# Altium schematic sheet USB_Sheet_2.SchDoc
size A4; DocumentNumber: 20; SheetNumber: 20; SheetTotal: 27
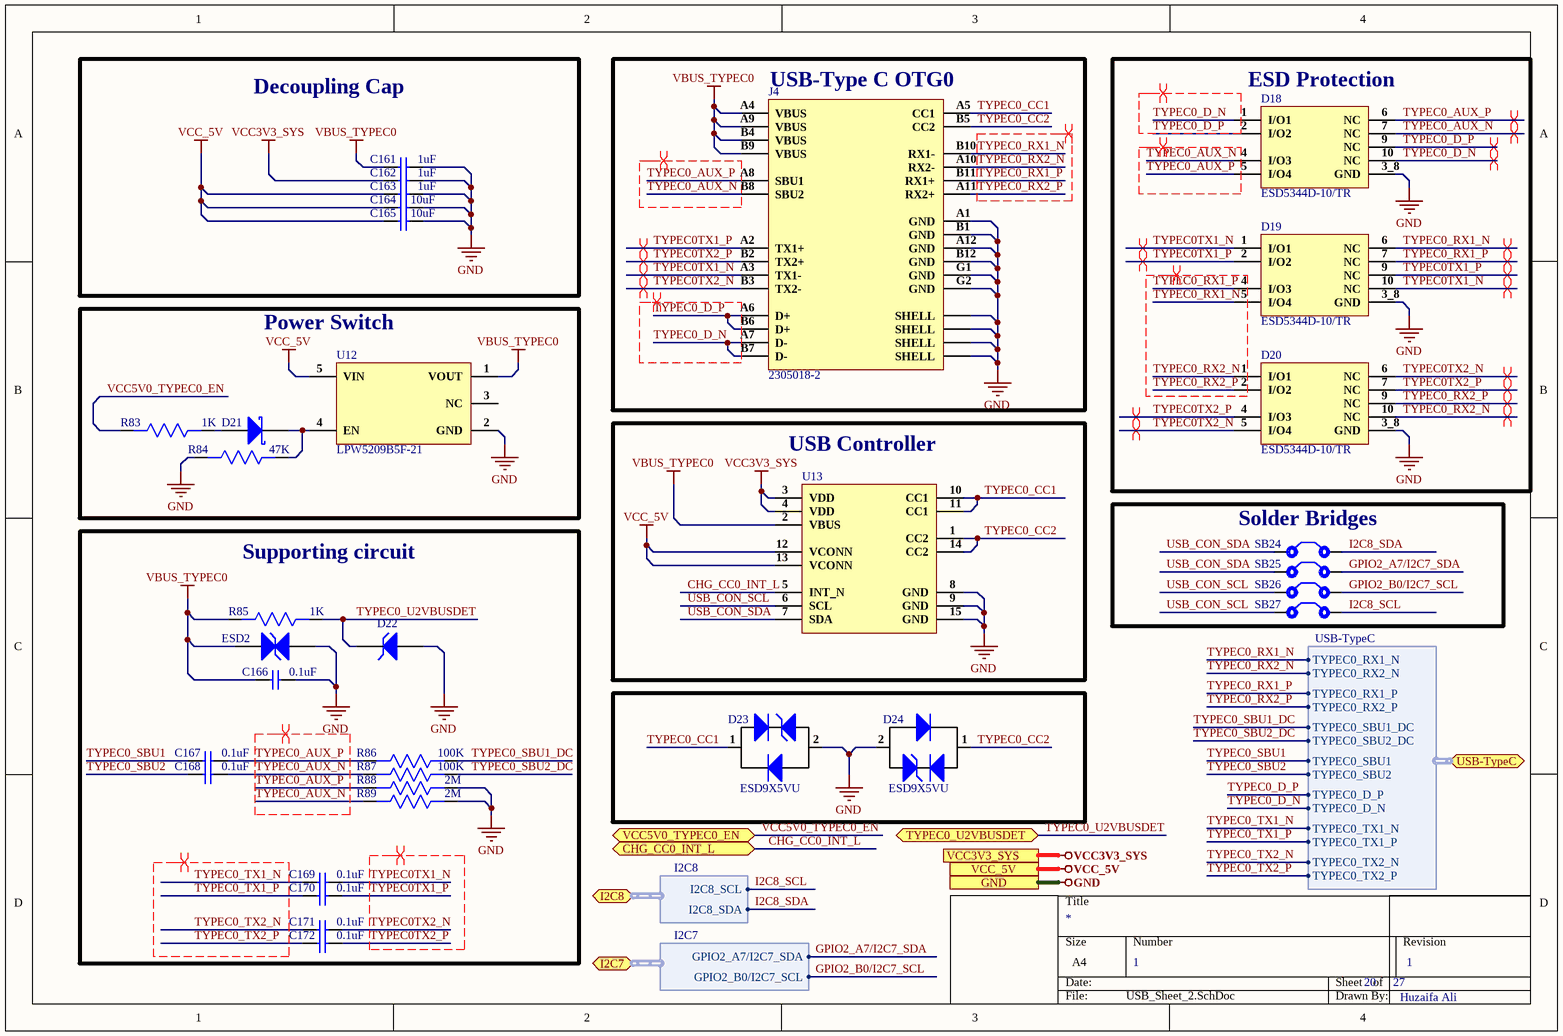
[diagram p0: USB_Sheet_2.SchDoc]

## Parts
C161  1uF  [Cap0402]
C162  1uF  [Cap0402]
C163  1uF  [Cap0402]
C164  10uF  [Cap0603]
C165  10uF  [Cap0603]
C166  0.1uF  [Cap0402]
C167  0.1uF  [Cap0402]
C168  0.1uF  [Cap0402]
C169  0.1uF  [Cap0402]
C170  0.1uF  [Cap0402]
C171  0.1uF  [Cap0402]
C172  0.1uF  [Cap0402]
D18  ESD5344D-10/TR  [DFN2510-10L]
D19  ESD5344D-10/TR  [DFN2510-10L]
D20  ESD5344D-10/TR  [DFN2510-10L]
D21  B5819WS  [SOD-323]  (value not drawn)
D22  BZT52C3V3-E3-08  [SOD-123]  (value not drawn)
D23  ESD9X5VU  [DFN1006-2L]
D24  ESD9X5VU  [DFN1006-2L]
ESD2  AZ5825-01F  [DFN1006-2L]  (value not drawn)
J4  2305018-2  [2305018-2]
R83  1K  [Res0603]
R84  47K  [Res0603]
R85  1K  [Res0603]
R86  100K  [Res0603]
R87  100K  [Res0603]
R88  2M  [Res0603]
R89  2M  [Res0603]
SB24  Solder Bridge  [Solder Bridge]  (value not drawn)
SB25  Solder Bridge  [Solder Bridge]  (value not drawn)
SB26  Solder Bridge  [Solder Bridge]  (value not drawn)
SB27  Solder Bridge  [Solder Bridge]  (value not drawn)
U12  LPW5209B5F-21  [SOT-23-5]
U13  FUSB302BMPX  [14-MLP (2.5x2.5)]  (value not drawn)

## Blocks framed on the sheet
Decoupling Cap: C161-C165
USB-Type C OTG0: J4
ESD Protection: D18-D20
Power Switch: D21 R83 R84 U12
USB Controller: U13
Solder Bridges: SB24-SB27
Supporting circuit: C166-C172 D22 ESD2 R85-R89

## Ports
CHG_CC0_INT_L (bidir), GND, I2C7 (bidir, harness I2C7), I2C8 (bidir, harness I2C8), TYPEC0_U2VBUSDET (bidir), USB-TypeC (bidir, harness USB-TypeC), VCC3V3_SYS, VCC5V0_TYPEC0_EN (bidir), VCC_5V

## Harnesses
I2C7: GPIO2_B0/I2C7_SCL, GPIO2_A7/I2C7_SDA
I2C8: I2C8_SDA, I2C8_SCL
USB-TypeC: TYPEC0_RX1_N, TYPEC0_RX2_N, TYPEC0_RX1_P, TYPEC0_RX2_P, TYPEC0_D_P, TYPEC0_D_N, TYPEC0_TX1_N, TYPEC0_TX1_P, TYPEC0_TX2_N, TYPEC0_TX2_P, TYPEC0_SBU1, TYPEC0_SBU2, TYPEC0_SBU1_DC, TYPEC0_SBU2_DC

## Nets
GND: C161.2 C162.2 C163.2 C164.2 C165.2 C166.2 D18.3_8(GND) D19.3_8(GND) D20.3_8(GND) D22.1(A) D23.2 D24.2 ESD2.2(A) J4.A1(GND) J4.A12(GND) J4.B1(GND) J4.B12(GND) J4.G1(GND) J4.G2(GND) J4.S1(SHELL) J4.S2(SHELL) J4.S3(SHELL) J4.S4(SHELL) R84.2 R88.1 R89.1 U12.2(GND) U13.8(GND) U13.9(GND) U13.15(GND) ; port GND
VBUS_TYPEC0: C161.1 C166.1 ESD2.1(A) J4.A4(VBUS) J4.A9(VBUS) J4.B4(VBUS) J4.B9(VBUS) R85.2 U12.1(VOUT) U13.2(VBUS)
VCC3V3_SYS: C162.1 U13.3(VDD) U13.4(VDD) ; port VCC3V3_SYS
VCC_5V: C163.1 C164.1 C165.1 U12.5(VIN) U13.12(VCONN) U13.13(VCONN) ; port VCC_5V
CHG_CC0_INT_L: U13.5(INT_N) ; port CHG_CC0_INT_L
GPIO2_A7/I2C7_SDA: SB25.2 ; port I2C7.GPIO2_A7/I2C7_SDA
GPIO2_B0/I2C7_SCL: SB26.2 ; port I2C7.GPIO2_B0/I2C7_SCL
I2C8_SCL: SB27.2 ; port I2C8.I2C8_SCL
I2C8_SDA: SB24.2 ; port I2C8.I2C8_SDA
TYPEC0_AUX_N: C168.2 D18.4(I/O3) D18.7(NC) J4.B8(SBU2) R87.2 R89.2
TYPEC0_AUX_P: C167.2 D18.5(I/O4) D18.6(NC) J4.A8(SBU1) R86.2 R88.2
TYPEC0_CC1: D23.1 J4.A5(CC1) U13.10(CC1) U13.11(CC1)
TYPEC0_CC2: D24.1 J4.B5(CC2) U13.1(CC2) U13.14(CC2)
TYPEC0_D_N: D18.1(I/O1) D18.10(NC) J4.A7(D-) J4.B7(D-) ; port USB-TypeC.TYPEC0_D_N
TYPEC0_D_P: D18.2(I/O2) D18.9(NC) J4.A6(D+) J4.B6(D+) ; port USB-TypeC.TYPEC0_D_P
TYPEC0_RX1_N: D19.5(I/O4) D19.6(NC) J4.B10(RX1-) ; port USB-TypeC.TYPEC0_RX1_N
TYPEC0_RX1_P: D19.4(I/O3) D19.7(NC) J4.B11(RX1+) ; port USB-TypeC.TYPEC0_RX1_P
TYPEC0_RX2_N: D20.1(I/O1) D20.10(NC) J4.A10(RX2-) ; port USB-TypeC.TYPEC0_RX2_N
TYPEC0_RX2_P: D20.2(I/O2) D20.9(NC) J4.A11(RX2+) ; port USB-TypeC.TYPEC0_RX2_P
TYPEC0_SBU1: C167.1 ; port USB-TypeC.TYPEC0_SBU1
TYPEC0_SBU1_DC: R86.1 ; port USB-TypeC.TYPEC0_SBU1_DC
TYPEC0_SBU2: C168.1 ; port USB-TypeC.TYPEC0_SBU2
TYPEC0_SBU2_DC: R87.1 ; port USB-TypeC.TYPEC0_SBU2_DC
TYPEC0_TX1_N: C169.1 ; port USB-TypeC.TYPEC0_TX1_N
TYPEC0_TX1_P: C170.1 ; port USB-TypeC.TYPEC0_TX1_P
TYPEC0_TX2_N: C171.1 ; port USB-TypeC.TYPEC0_TX2_N
TYPEC0_TX2_P: C172.1 ; port USB-TypeC.TYPEC0_TX2_P
TYPEC0_U2VBUSDET: D22.2(K) R85.1 ; port TYPEC0_U2VBUSDET
TYPEC0TX1_N: C169.2 D19.1(I/O1) D19.10(NC) J4.A3(TX1-)
TYPEC0TX1_P: C170.2 D19.2(I/O2) D19.9(NC) J4.A2(TX1+)
TYPEC0TX2_N: C171.2 D20.5(I/O4) D20.6(NC) J4.B3(TX2-)
TYPEC0TX2_P: C172.2 D20.4(I/O3) D20.7(NC) J4.B2(TX2+)
USB_CON_SCL: SB26.1 SB27.1 U13.6(SCL)
USB_CON_SDA: SB24.1 SB25.1 U13.7(SDA)
VCC5V0_TYPEC0_EN: R83.2 ; port VCC5V0_TYPEC0_EN
NetD21_1: D21.1(K) R84.1 U12.4(EN)
NetD21_2: D21.2(A) R83.1

Not connected (* = marked no-connect by the designer): U12 3(NC)

## Layout directives
differential pair; differential pair class TYPEC0_IO_Lines; net class TYPEC0; rule Matched Net Lengths [Tolerance = 50mil]; rule Impedance Constraint [Min = 85.00    Max = 90.00    ]: TYPEC0_D_N, TYPEC0_D_P, TYPEC0_RX1_N, TYPEC0_RX1_P, TYPEC0_RX2_N, TYPEC0_RX2_P, TYPEC0_TX1_N, TYPEC0_TX1_P, TYPEC0_TX2_N, TYPEC0_TX2_P, TYPEC0TX1_N, TYPEC0TX1_P, TYPEC0TX2_N, TYPEC0TX2_P
differential pair; differential pair class TYPEC0_AUX_Lines; net class TYPEC0_AUX; rule Matched Net Lengths [Tolerance = 300mil]; rule Impedance Constraint [Min = 85.00    Max = 90.00    ]: TYPEC0_AUX_N, TYPEC0_AUX_P
differential pair; differential pair class TYPEC0_TX_Lines; net class TYPEC0_TX; rule Matched Net Lengths [Tolerance = 50mil]; rule Impedance Constraint [Min = 85.00    Max = 90.00    ]: TYPEC0TX1_N, TYPEC0TX1_P, TYPEC0TX2_N, TYPEC0TX2_P

## Notes on the sheet
- 1
- Huzaifa Ali

## Library data of the parts
C161-C163 = GRM155R61E105KA12D: CAP CER 1UF 25V X5R 0402; Manufacturer: Murata; Material: Ceramic; Tolerance: 10%; Supplier 1: Digi-Key; Manufacturer Part Number: GRM155R61E105KA12D; Stock 1: 1194305; Pricing 1: 1=0.11, 10=0.077, 100=0.0363, 500=0.02546, 1000=0.02108, 2500=0.01962, 5000=0.01795 (USD); Mount: Surface Mount; Case/Package: 0402; Weight: 0.000212oz; Case Code (Metric): 1005; Case Code (Imperial): 0402; Min Operating Temperature: -55°C; Max Operating Temperature: 85°C; Capacitance: 1uF; Voltage Rating: 25V; Packaging: Tape and Reel; Dielectric: X5R; Voltage: 25V; Termination: SMD/SMT; Voltage Rating (DC): 25V; Package Quantity: 10000; Length: 1mm; Height: 0.5mm; Width: 0.5mm; Thickness: 0.022inch; Depth: 0.5mm; REACH SVHC: No SVHC; Lead Free: Lead Free; ComponentLink1URL: http://www.farnell.com/datasheets/2048341.pdf?src-supplier=Element14; ComponentLink1Description: http://www.farnell.com/datasheets/2048341.pdf?src-supplier=Element14; Supplier Part Number 1: 490-10017-1-ND
C164 C165 = C1608X5R1E106M080AC: CAP CER 10UF 25V X5R 0603; Manufacturer: TDK; Dielectric Material: Ceramic; Tolerance: 20%; Supplier 1: Digi-Key; Manufacturer Part Number: C1608X5R1E106M080AC; Stock 1: 61681; Pricing 1: 1=0.96, 10=0.704, 100=0.483, 500=0.38238, 1000=0.322 (USD); Mount: Surface Mount; Case/Package: 0603; Weight: 7.1E-05oz; Case Code (Imperial): 0603; Case Code (Metric): 1608; Min Operating Temperature: -55°C; Max Operating Temperature: 85°C; Capacitance: 10uF; Packaging: Tape and Reel; Voltage Rating: 25V; Voltage Rating (DC): 25V; Termination: SMD/SMT; Package Quantity: 1; Dielectric: X5R; Composition: Ceramic; Length: 1.6mm; Height: 0.8mm; Width: 0.8mm; Thickness: 0.039inch; Depth: 0.8mm; Lead Free: Lead Free; REACH SVHC: No SVHC; Supplier Part Number 1: 445-9015-1-ND
C166-C172 = CC0402KRX5R6BB104: CAP CER 0.1UF 10V X5R 0402; Manufacturer: Yageo; Capacitance: 100nF; Tolerance: 10%; Dissipation Factor: 5%; Insulation Resistance: 10GR; Supplier 1: Digi-Key; Manufacturer Part Number: CC0402KRX5R6BB104; RoHS: Yes; Category: Ceramic Capacitors; Stock 1: 6385580; Pricing 1: 1=0.10000, 10=0.02700, 50=0.01500, 100=0.01220, 500=0.00874, 1000=0.00687, 2500=0.00625, 5000=0.00575 (USD); Mount: Surface Mount; Case/Package: 0402; Number of Pins: 2; Case Code (Imperial): 0402; Case Code (Metric): 1005; Min Operating Temperature: -55°C; Max Operating Temperature: 85°C; Dielectric: X5R; Packaging: Tape and Reel; Voltage Rating: 10V; Package Quantity: 1; Termination: SMD/SMT; Voltage Rating (DC): 10V; Series: CC; Length: 1mm; Width: 0.02inch; Height: 0.5mm; Depth: 0.5mm; Thickness: 0.022inch; Radiation Hardening: No; RoHS Compliant: Yes; REACH SVHC: No SVHC; Lead Free: Lead Free; Halogen Free: Halogen Free; ComponentLink1URL: https://datasheet.ciiva.com/144/mlccorderingcode-144029.pdf?src-supplier=Digi-Key; ComponentLink1Description: https://datasheet.ciiva.com/144/mlccorderingcode-144029.pdf?src-supplier=Digi-Key; ComponentLink2URL: https://datasheet.ciiva.com/144/mlccorderingcode-144028.pdf?src-supplier=Digi-Key; ComponentLink2Description: https://datasheet.ciiva.com/144/mlccorderingcode-144028.pdf?src-supplier=Digi-Key; ComponentLink3URL: https://datasheet.ciiva.com/144/mlccorderingcode-144030.pdf?src-supplier=Digi-Key; ComponentLink3Description: https://datasheet.ciiva.com/144/mlccorderingcode-144030.pdf?src-supplier=Digi-Key; ComponentLink4URL: https://datasheet.ciiva.com/7978/1359354-7978091.pdf?src-supplier=Element14; ComponentLink4Description: https://datasheet.ciiva.com/7978/1359354-7978091.pdf?src-supplier=Element14; ComponentLink5URL: https://datasheet.ciiva.com/11587/upy-gphc-x5r-4v-to-50v-12-11587302.pdf?src-supplier=Avnet; ComponentLink5Description: https://datasheet.ciiva.com/11587/upy-gphc-x5r-4v-to-50v-12-11587302.pdf?src-supplier=Avnet; Supplier Part Number 1: 311-1336-1-ND
D18-D20 = ESD5344D-10/TR: DFN2510-10L ESD Protection Devices ROHS; Manufacturer: WILLSEMI; ComponentLink1Description: LCSC; ComponentLink1URL: https://www.lcsc.com/product-detail/span-style-background-color-ff0-ESD-span-Protection-Devices_WILLSEMI-Will-Semicon-ESD5344D-10-TR_C239666.html; Manufacturer Part Number: ESD5344D-10/TR
D21 = B5819WS: DIODE SCHOTTKY 40V 1A SOD323; Manufacturer: MDD; Manufacturer Part Number: B5819WS-TP; Max Surge Current: 10A; Forward Voltage: 900mV; Max Reverse Leakage Current: 1mA; Element Configuration: Single; Supplier 1: Arrow Electronics; RoHS: Yes; Category: Rectifier Diodes; Stock 1: 1701; Pricing 1: 1=0.34370, 10=0.18990, 25=0.18810, 100=0.11820, 250=0.11700, 500=0.08890, 1000=0.07420 (USD); Mount: Surface Mount; Number of Pins: 2; Min Operating Temperature: -65°C; Max Operating Temperature: 125°C; Package Quantity: 1; Packaging: Tape and Reel; Average Rectified Current: 1A; Peak Non-Repetitive Surge Current: 10A; Max Reverse Voltage (DC): 40V; Series: -; Radiation Hardening: No; RoHS Compliant: Yes; Lead Free: Lead Free; Supplier Part Number 1: B5819WS-TP; ComponentLink1Description: LCSC; ComponentLink1URL: https://lcsc.com/product-detail/Schottky-Barrier-Diodes-SBD_MDD-Microdiode-Electronics-B5819WS_C64886.html
D22 = BZT52C3V3-E3-08: Diode Zener Single 3.3V 6% 500mW 2-Pin SOD-123; Manufacturer: Vishay; Max Power Dissipation: 410mW; Impedance: 80R; Voltage Tolerance: 5%; Zener Current: 109mA; Max Reverse Leakage Current: 100nA; Test Current: 5mA; ESD Protection: Yes; Supplier 1: Newark; Manufacturer Part Number: BZT52C3V3-E3-08; RoHS: Yes; Category: Zener Diodes; Pricing 1: 1=0.28100, 10=0.19500, 25=0.16300, 50=0.13100, 100=0.09800, 250=0.09200, 500=0.08500, 1000=0.05700 (USD); Mount: Surface Mount; Number of Pins: 2; Contact Plating: Tin,Matte; Min Operating Temperature: -55°C; Max Operating Temperature: 150°C; Zener Voltage: 3.3V; Element Configuration: Single; Power Dissipation: 500mW; Packaging: Tape and Reel; Package Quantity: 3000; Tolerance: 5%; Radiation Hardening: No; ComponentLink1URL: https://datasheet.ciiva.com/24094/bzt52-106265-24094953.pdf?src-supplier=Mouser; ComponentLink1Description: https://datasheet.ciiva.com/24094/bzt52-106265-24094953.pdf?src-supplier=Mouser; Supplier Part Number 1: 06AC5888
D23 D24 = ESD9X5VU: DFN1006-2 ESD Protection Devices ROHS; Manufacturer: TECH PUBLIC; Manufacturer Part Number: ESD9X5VU; Footprint: DFN1006-2; ComponentLink1Description: LCSC; ComponentLink1URL: https://www.lcsc.com/product-detail/span-style-background-color-ff0-ESD-span-Protection-Devices_TECH-PUBLIC-ESD9X5VU_C2875160.html
ESD2 = AZ5825-01F: DFN1006P ESD Protection Devices ROHS; Manufacturer: TECH PUBLIC; ComponentLink1Description: LCSC; ComponentLink1URL: https://lcsc.com/product-detail/ESD-Protection-Devices_TECH-PUBLIC-AZ5825-01F_C2905641.html; Footprint: FN1006P; Manufacturer Part Number: AZ5825-01F
J4 = 2305018-2: CONN RCP USB3.1 TYPEC 24P SMD RA; Manufacturer: TE Connectivity AMP; Connector Type: USB; Number of Contacts: 24; Gender: Receptacle; Number of Ports: 1; Current Rating: 1.25A; Voltage Rating: 30V; Shielding: Shielded; Ratings: Waterproof; Supplier 1: Digi-Key; Manufacturer Part Number: 2305018-2; RoHS: Yes; Category: USB Connectors; Stock 1: 4590; Pricing 1: 1=3.00000, 10=2.87800, 25=2.63840, 50=2.51840, 100=2.39840, 250=2.09864 (USD); Mount: Surface Mount,Through Hole; Contact Plating: Gold; Insulation Color: Black; Min Operating Temperature: -40°C; Max Operating Temperature: 85°C; Packaging: Tape and Reel; Termination: Solder; Flammability Rating: UL94 V-0; RoHS Compliant: Yes; ComponentLink1URL: http://www.farnell.com/datasheets/2611889.pdf?src-supplier=Farnell; ComponentLink1Description: http://www.farnell.com/datasheets/2611889.pdf?src-supplier=Farnell; ComponentLink2URL: https://www.te.com/commerce/DocumentDelivery/DDEController?Action=srchrtrv&DocNm=2305018&DocType=Customer+Drawing&DocLang=English&src-supplier=Digi-Key; ComponentLink2Description: https://www.te.com/commerce/DocumentDelivery/DDEController?Action=srchrtrv&DocNm=2305018&DocType=Customer+Drawing&DocLang=English&src-supplier=Digi-Key; ComponentLink3URL: http://www.farnell.com/datasheets/2611889.pdf?src-supplier=Newark; ComponentLink3Description: http://www.farnell.com/datasheets/2611889.pdf?src-supplier=Newark; Supplier Part Number 1: A132569CT-ND
R83 R85 = RT0603DRD071KL: RES SMD 1K OHM 0.5% 1/10W 0603; Manufacturer: Yageo; Resistance: 1kR; Temperature Coefficient: 25ppm/°C; Power Rating: 100mW; Voltage Rating: 75V; Voltage Rating (DC): 50V; Supplier 1: Digi-Key; Manufacturer Part Number: RT0603DRD071KL; Stock 1: 178947; Pricing 1: 1=0.2, 10=0.167, 100=0.0651, 1000=0.02725, 2500=0.02498 (USD); Case/Package: 0603; Contact Plating: Tin,Matte; Case Code (Metric): 1608; Case Code (Imperial): 0603; Min Operating Temperature: -55°C; Max Operating Temperature: 125°C; Tolerance: 0.5%; Composition: Thin Film; Packaging: Tape and Reel; Termination: SMD/SMT; Radiation Hardening: No; Lead Free: Lead Free; ComponentLink1URL: http://www.mouser.com/ds/2/447/yageodocoutput-1125656.pdf?src-supplier=Mouser; ComponentLink1Description: http://www.mouser.com/ds/2/447/yageodocoutput-1125656.pdf?src-supplier=Mouser; ComponentLink2URL: http://www.yageo.com/documents/recent/PYu-RT_1-to-0.05_RoHS_L_6.pdf?src-supplier=Avnet; ComponentLink2Description: http://www.yageo.com/documents/recent/PYu-RT_1-to-0.05_RoHS_L_6.pdf?src-supplier=Avnet; Supplier Part Number 1: 311-1.0KDDKR-ND
R84 = RC0603JR-0747KL: Res Thick Film 0603 30K Ohm 1% 0.1W(1/10W) ±100ppm/C Epoxy Pad SMD T/R; Manufacturer: Yageo; Resistance: 47kR; Tolerance: 5%; Power Rating: 100mW; Voltage Rating (DC): 50V; Temperature Coefficient: 100ppm/°C; Supplier 1: Arrow; Manufacturer Part Number: RC0603JR-0747KL; Stock 1: 599135; Pricing 1: 5000=0.0025, 10000=0.0022, 25000=0.0019, 1=0.0011, 6000=0.001 (USD); Case/Package: 0603; Number of Pins: 2; Case Code (Imperial): 0603; Case Code (Metric): 1608; Min Operating Temperature: -55°C; Max Operating Temperature: 155°C; Packaging: Tape and Reel; Voltage Rating: 50V; Package Quantity: 5000; Termination: SMD/SMT; Military Standard: Not; Composition: Thick Film; Length: 1.6mm; Height: 0.45mm; Width: 0.8mm; Depth: 0.8mm; REACH SVHC: No SVHC; Lead Free: Lead Free; ComponentLink1URL: http://www.farnell.com/datasheets/443971.pdf; ComponentLink1Description: http://www.farnell.com/datasheets/443971.pdf; ComponentLink2URL: http://www.mouser.com/catalog/specsheets/RC0603.pdf; ComponentLink2Description: http://www.mouser.com/catalog/specsheets/RC0603.pdf; Supplier Part Number 1: RC0603JR-0747KL; Supplier 2: Digi-Key; RoHS: Yes; Category: Chip SMD Resistors; Stock 2: 1087850; Pricing 2: 1=0.10000, 10=0.02300, 100=0.00930, 1000=0.00417, 2500=0.00362 (USD); Size Code: 0603; Number of Terminations: 2; Resistor Type: Thick Film; Features: Moisture Resistant; Series: RC; Max Power Dissipation: 100mW; Construction: Rectangular; Resistance Tolerance: 1%; RoHS Compliant: Yes; ComponentLink3URL: https://datasheet.ciiva.com/46395/443971-46395003.pdf?src-supplier=Element14; ComponentLink3Description: https://datasheet.ciiva.com/46395/443971-46395003.pdf?src-supplier=Element14; ComponentLink4URL: https://datasheet.ciiva.com/12558/rc0603-272842-12558744.pdf?src-supplier=Mouser; ComponentLink4Description: https://datasheet.ciiva.com/12558/rc0603-272842-12558744.pdf?src-supplier=Mouser; Supplier Part Number 2: 311-30.0KHRCT-ND
R86 R87 = RT0603BRD07100KL: RES SMD 100K OHM 0.1% 1/10W 0603; Manufacturer: Yageo; Resistance: 100kR; Temperature Coefficient: 25ppm/°C; Voltage Rating (DC): 75V; Power Rating: 100mW; Supplier 1: Digi-Key; Manufacturer Part Number: RT0603BRD07100KL; Stock 1: 53395; Pricing 1: 1=0.39, 10=0.332, 100=0.1298, 1000=0.05435, 2500=0.04982 (USD); Mount: Surface Mount; Case/Package: 0603; Case Code (Imperial): 0603; Case Code (Metric): 1608; Min Operating Temperature: -55°C; Max Operating Temperature: 125°C; Tolerance: 0.1%; Composition: Thin Film; Packaging: Tape and Reel; Voltage Rating: 75V; Package Quantity: 5000; Termination: SMD/SMT; Number of Terminations: 2; Military Standard: Not; Max Power Dissipation: 100mW; Working Voltage: 75V; Features: Moisture Resistant; Length: 1.6mm; Height: 0.022inch; Width: 0.031inch; Depth: 0.8mm; Lead Free: Lead Free; ComponentLink1URL: http://documents.rs-components.com/techlib://itc_doclist_GB.htm?stockno=6174810&src-supplier=RSComponents; ComponentLink1Description: http://documents.rs-components.com/techlib://itc_doclist_GB.htm?stockno=6174810&src-supplier=RSComponents; Supplier Part Number 1: YAG1235CT-ND
R88 R89 = RC0603FR-072ML: RES 2M OHM 1% 1/10W 0603; Manufacturer: Yageo; Resistance: 2MR; Power Rating: 100mW; Voltage Rating: 75V; Temperature Coefficient: 100ppm/°C; Voltage Rating (DC): 50V; Supplier 1: Digi-Key; Manufacturer Part Number: RC0603FR-072ML; RoHS: Yes; Category: Chip SMD Resistors; Stock 1: 382342; Pricing 1: 1=0.10000, 10=0.02300, 100=0.00930, 1000=0.00417, 2500=0.00362 (USD); Mount: Surface Mount; Case/Package: 0603; Case Code (Imperial): 0603; Case Code (Metric): 1608; Weight: 7.1E-05oz; Size Code: 0603; Min Operating Temperature: -55°C; Max Operating Temperature: 155°C; Tolerance: 1%; Packaging: Tape and Reel; Package Quantity: 1; Termination: SMD/SMT; Resistor Type: Thick Film; Number of Terminations: 2; Max Power Dissipation: 100mW; Features: Moisture Resistant; Series: RC; Technology: THICK FILM; Length: 1.6mm; Width: 0.8mm; Height: 0.45mm; Depth: 0.8mm; Lead Free: Lead Free; RoHS Compliant: Yes; ComponentLink1URL: https://datasheet.ciiva.com/11808/0900766b80f96399-11808743.pdf?src-supplier=RSComponents; ComponentLink1Description: https://datasheet.ciiva.com/11808/0900766b80f96399-11808743.pdf?src-supplier=RSComponents; ComponentLink2URL: https://datasheet.ciiva.com/2454/pyu-r-int-thick-7-2454115.pdf?src-supplier=Digi-Key; ComponentLink2Description: https://datasheet.ciiva.com/2454/pyu-r-int-thick-7-2454115.pdf?src-supplier=Digi-Key; ComponentLink3URL: https://datasheet.ciiva.com/2454/pyu-r-int-thick-7-2454116.pdf?src-supplier=Digi-Key; ComponentLink3Description: https://datasheet.ciiva.com/2454/pyu-r-int-thick-7-2454116.pdf?src-supplier=Digi-Key; ComponentLink4URL: https://datasheet.ciiva.com/2454/pyu-r-int-thick-7-2454114.pdf?src-supplier=Digi-Key; ComponentLink4Description: https://datasheet.ciiva.com/2454/pyu-r-int-thick-7-2454114.pdf?src-supplier=Digi-Key; Supplier Part Number 1: 311-2.00MHRCT-ND
SB24-SB27 = Solder Bridge: Solder Bridge ON
U12 = LPW5209B5F-21: 2.1Amp SOT-23-5 Power Distribution Switches ROHS; Manufacturer: LOWPOWER; Supplier 1: LCSC; Manufacturer Part Number: LPW5209B5F-21; RoHS: No; Stock 1: 3390; Pricing 1: 5=0.14760, 50=0.12140, 150=0.10820, 500=0.09840, 2500=0.09050, 5000=0.08660 (USD); Supplier Part Number 1: C517266
U13 = FUSB302BMPX: Full Speed Programmable USB Power Delivery Controller USB 3.1 3.3V T/R 14-Pin WQFN EP; Manufacturer: ON Semiconductor / Fairchild; Operating Supply Current: 25uA; Supplier 1: RSComponents; Manufacturer Part Number: FUSB302BMPX; RoHS: Yes; Category: Integrated Circuits (ICs); Stock 1: 95; Pricing 1: 3000=0.62400 (GBP); Mount: Surface Mount; Min Operating Temperature: -40°C; Max Operating Temperature: 85°C; Interface: USB; Packaging: Cut Tape; RoHS Compliant: Yes; ComponentLink1URL: http://www.farnell.com/datasheets/2313409.pdf?src-supplier=Farnell; ComponentLink1Description: http://www.farnell.com/datasheets/2313409.pdf?src-supplier=Farnell; ComponentLink2URL: http://www.mouser.com/ds/2/149/FUSB302-769336.pdf?src-supplier=Mouser; ComponentLink2Description: http://www.mouser.com/ds/2/149/FUSB302-769336.pdf?src-supplier=Mouser; ComponentLink3URL: https://www.fairchildsemi.com/datasheets/FU/FUSB302.pdf?src-supplier=Digi-Key; ComponentLink3Description: https://www.fairchildsemi.com/datasheets/FU/FUSB302.pdf?src-supplier=Digi-Key; Supplier Part Number 1: 1464429; Supplier 2: Digi-Key; Stock 2: 9412; Pricing 2: 1=1.27000, 10=1.13500, 25=1.07720, 100=0.88500, 250=0.82728, 500=0.73108, 1000=0.57717 (USD); ComponentLink4URL: http://www.farnell.com/datasheets/2313408.pdf?src-supplier=Farnell; ComponentLink4Description: http://www.farnell.com/datasheets/2313408.pdf?src-supplier=Farnell; ComponentLink5URL: http://www.onsemi.com/pub/Collateral/FUSB302B-D.PDF?src-supplier=Digi-Key; ComponentLink5Description: http://www.onsemi.com/pub/Collateral/FUSB302B-D.PDF?src-supplier=Digi-Key; Supplier Part Number 2: FUSB302BMPXCT-ND